# EasyEDA Pro project bliysfyt-night-light-af2cf507.epro, board PCB2
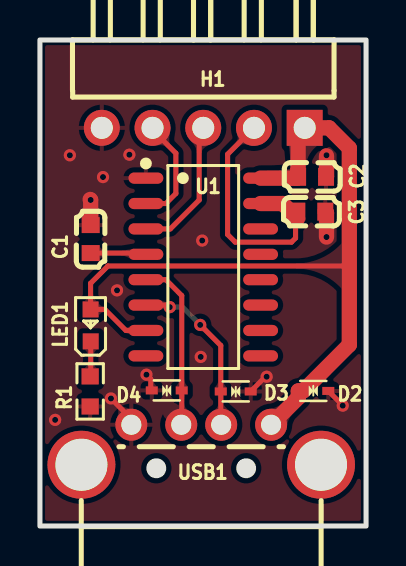
[diagram p5: board, top side]
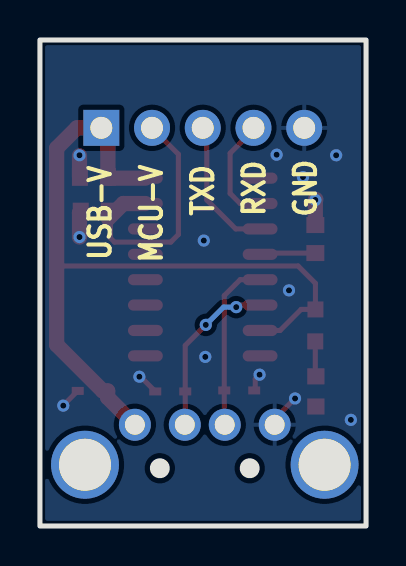
[diagram p6: board, bottom side, seen from below]

Outline 16.33 x 24.31 mm; copper layers: Top Layer, Bottom Layer. Coordinates in mm from the lower left corner of the outline.
Outline path: rectangle 0,24.31 16.33,0
Stack: Top Layer 0.035mm / Dielectric1 1.51mm FR4 er 4.5 / Bottom Layer 0.035mm

## Design rules (mm)
net USB2_D+: DP1
net USB2_D-: DP1
spacing copperThickness1oz (default): track to track 0.102, other pairs 0.152 to 0.3
spacing copperThickness2oz: track to track 0.203, other pairs 0.152 to 0.3
spacing Plane_innerPlane: track to track 0.102, other pairs 0.152 to 0.3
spacing Copper_copperRegion: track to track 0.102, other pairs 0.152 to 0.3
track width copperThickness1oz (default): min 0.127, default 0.254, max 2.54
track width copperThickness2oz: min 0.203, default 0.254, max 2.54
differential pair differentialPair (default): width min 0.127, default 0.254, max 2.54; gap min 0.152, default 0.152
pour e84 uses Copper_copperRegion
pour e122 uses Copper_copperRegion

## Placement (name value [footprint] x y rotation side)
C1  100nF  [C0603]  2.54 14.35 90 top
C2  1uF  [C0603]  13.63 17.46 180 top
C3  1uF  [C0603]  13.59 15.72 180 top
D2  LESD5D5.0CT1G  [SOD-523_L1.2-W0.8-LS1.6-BI]  13.69 6.76 180 top
D3  LESD5D5.0CT1G  [SOD-523_L1.2-W0.8-LS1.6-BI]  9.81 6.73 0 top
D4  LESD5D5.0CT1G  [SOD-523_L1.2-W0.8-LS1.6-BI]  6.35 6.78 0 top
H1  PZ254R-11-05P  [HDR-TH_5P-P2.54-H-M-W10.4]  8.18 19.91 180 top
LED1  NCD0603R1  [LED0603-RD_RED]  2.54 10.03 90 top
R1  200Ω  [R0603]  2.51 6.73 90 top
U1  CH343G  [SOP-16_L10.0-W3.9-P1.27-LS6.0-BL]  8.18 12.95 270 top
USB1  AM90  [USB-AM-TH_AM90]  8.08 4.06 0 top

## Footprints (pads in the part's own frame, mm; a bottom-side part is the same pattern mirrored in y, then rotated)
C0603
  rect 0.8x0.9 smd: 1(-0.7,0) 2(0.7,0)
HDR-TH_5P-P2.54-H-M-W10.4
  rect 1.8x1.8 hole 1.1: 1(-5.08,0)
  round 1.8 hole 1.1: 2(-2.54,0) 3(0,0) 4(2.54,0) 5(5.08,0)
LED0603-RD_RED
  rect 0.8x0.8 smd: 1(-0.799,-0.004) 2(0.799,0.004)
R0603
  rect 0.806x0.864 smd: 1(-0.753,0) 2(0.753,0)
SOD-523_L1.2-W0.8-LS1.6-BI
  rect 0.6x0.4 smd: 1(-0.75,0) 2(0.75,0)
SOP-16_L10.0-W3.9-P1.27-LS6.0-BL
  oval 0.56x1.745 smd: 1(-4.445,-2.873) 2(-3.175,-2.873) 3(-1.905,-2.873) 4(-0.635,-2.873) 5(0.635,-2.873) 6(1.905,-2.873) 7(3.175,-2.873) 8(4.445,-2.873) 9(4.445,2.873) 10(3.175,2.873) 11(1.905,2.873) 12(0.635,2.873) 13(-0.635,2.873) 14(-1.905,2.873) 15(-3.175,2.873) 16(-4.445,2.873)
USB-AM-TH_AM90
  round 1.6 hole 1: 1(3.5,1) 2(1,1) 3(-1,1) 4(-3.5,1)
  round 3.4 hole 2.6: MH1(6,-1) MH2(-6,-1)

## Nets
As in the schematic.

Pads without a net: U1 8 9 10 11 12 13 14; USB1 MH1 MH2

## Via types
v1: diameter 0.61, hole 0.305, Top Layer to Bottom Layer, 16 vias

## Routing (per net, layer and track width the routed paths; a pad name or vN(x,y) marks a point on that pad's centre or on a via; arc(x,y) is an arc through that point)
GND: length 8.3
  Top Layer w0.254: v1(3.56,6.38) 4.72,5.21 USB1.4 ; D3.2 11.23,7.4 11.23,7.42 ; 5.55,6.86 5.55,7.35 v1(5.33,7.57) ; v1(15.16,6.02) 15.16,6.03 D2.1
  Top Layer w0.762: 2.51,16.33 v1(2.54,16.31) 2.54,15.05 ; v1(14.35,14.45) 14.35,15.66 C3.1 ; C2.1 14.35,17.49 14.35,18.52
  vias: v1(0.76,5.31) v1(1.5,18.54) v1(3.16,17.45) v1(3.86,11.79) v1(4.48,18.57) v1(8.13,14.28) v1(8.05,8.46) v1(11.35,7.47) v1(14.35,18.54)
VCC-3.3V: length 12.6
  Top Layer w0.254: 10.67,19.86 9.4,18.59 9.4,14.58 9.78,14.2 12.6,14.2 12.8,14.4 12.8,15.28 12.9,15.38
  Top Layer w0.762: 12.9,15.38 12.16,16.13 U1.15
VIN2: length 40.3
  Top Layer w0.254: U1.7 4.31,9.78 3.25,10.83 LED1.2 2.54,12.14 3.4,13 15.16,13 15.19,13.03
  Top Layer w0.762: U1.16 12.86,17.4 C2.2 12.93,19.58 H1.1 14.48,19.91 15.49,18.9 15.49,9.06 13.19,6.76 D2.2 12.94,6.43 USB1.1
RXD0: length 5.4
  Top Layer w0.254: 5.59,19.86 6.81,18.64 6.81,16.63 6.31,16.13 U1.2
TXD0: length 6.9
  Top Layer w0.254: U1.3 6.53,14.86 7.98,16.31 7.98,19.71 8.13,19.86
USB2_D+: length 8.6
  Top Layer w0.254: U1.5 6.31,12.32 7.1,11.52 D4.2 7.1,5.09 USB1.3
USB2_D-: length 8.6
  Top Layer w0.254: v1(6.5,10.95) 6.4,11.05 U1.6 ; v1(8.03,10.06) 9.06,9.03 D3.1 9.06,5.09 USB1.2
  Bottom Layer w0.254: v1(8.03,10.06) 7.14,10.95 v1(6.5,10.95)
$1N711: length 2.8
  Top Layer w0.254: C1.1 5.24,13.65 U1.4
$1N1523: length 1.8
  Top Layer w0.254: LED1.1 2.54,7.51 R1.2

## Copper pours and planes (outline as drawn; the poured copper is in the pictures)
GND on Top Layer: -1.25,25.88 17.63,25.88 17.63,-0.79 -1.25,-0.79
GND on Bottom Layer: -0.31,24.73 16.64,24.73 16.64,-0.33 -0.31,-0.33

Small or netless copper shapes (teardrops, artwork), in the pictures only: 34 on Top Layer, 2 on Bottom Layer

## Text on the board
Bottom Silkscreen Layer: GND | RXD | TXD | MCU-V | USB-V
